# EasyEDA Pro project ProPrj_nfc keychain with screen_.epro

# Schematic Schematic1
Board Name: Board1; Create Date: 2026-09-26; Page Name: P1; Project Name: nfc keychain with screen; Schematic Name: Schematic1; Update Date: 2026-09-26; Company: EasyEDA.com; Page Size: A4; Version: V1.0
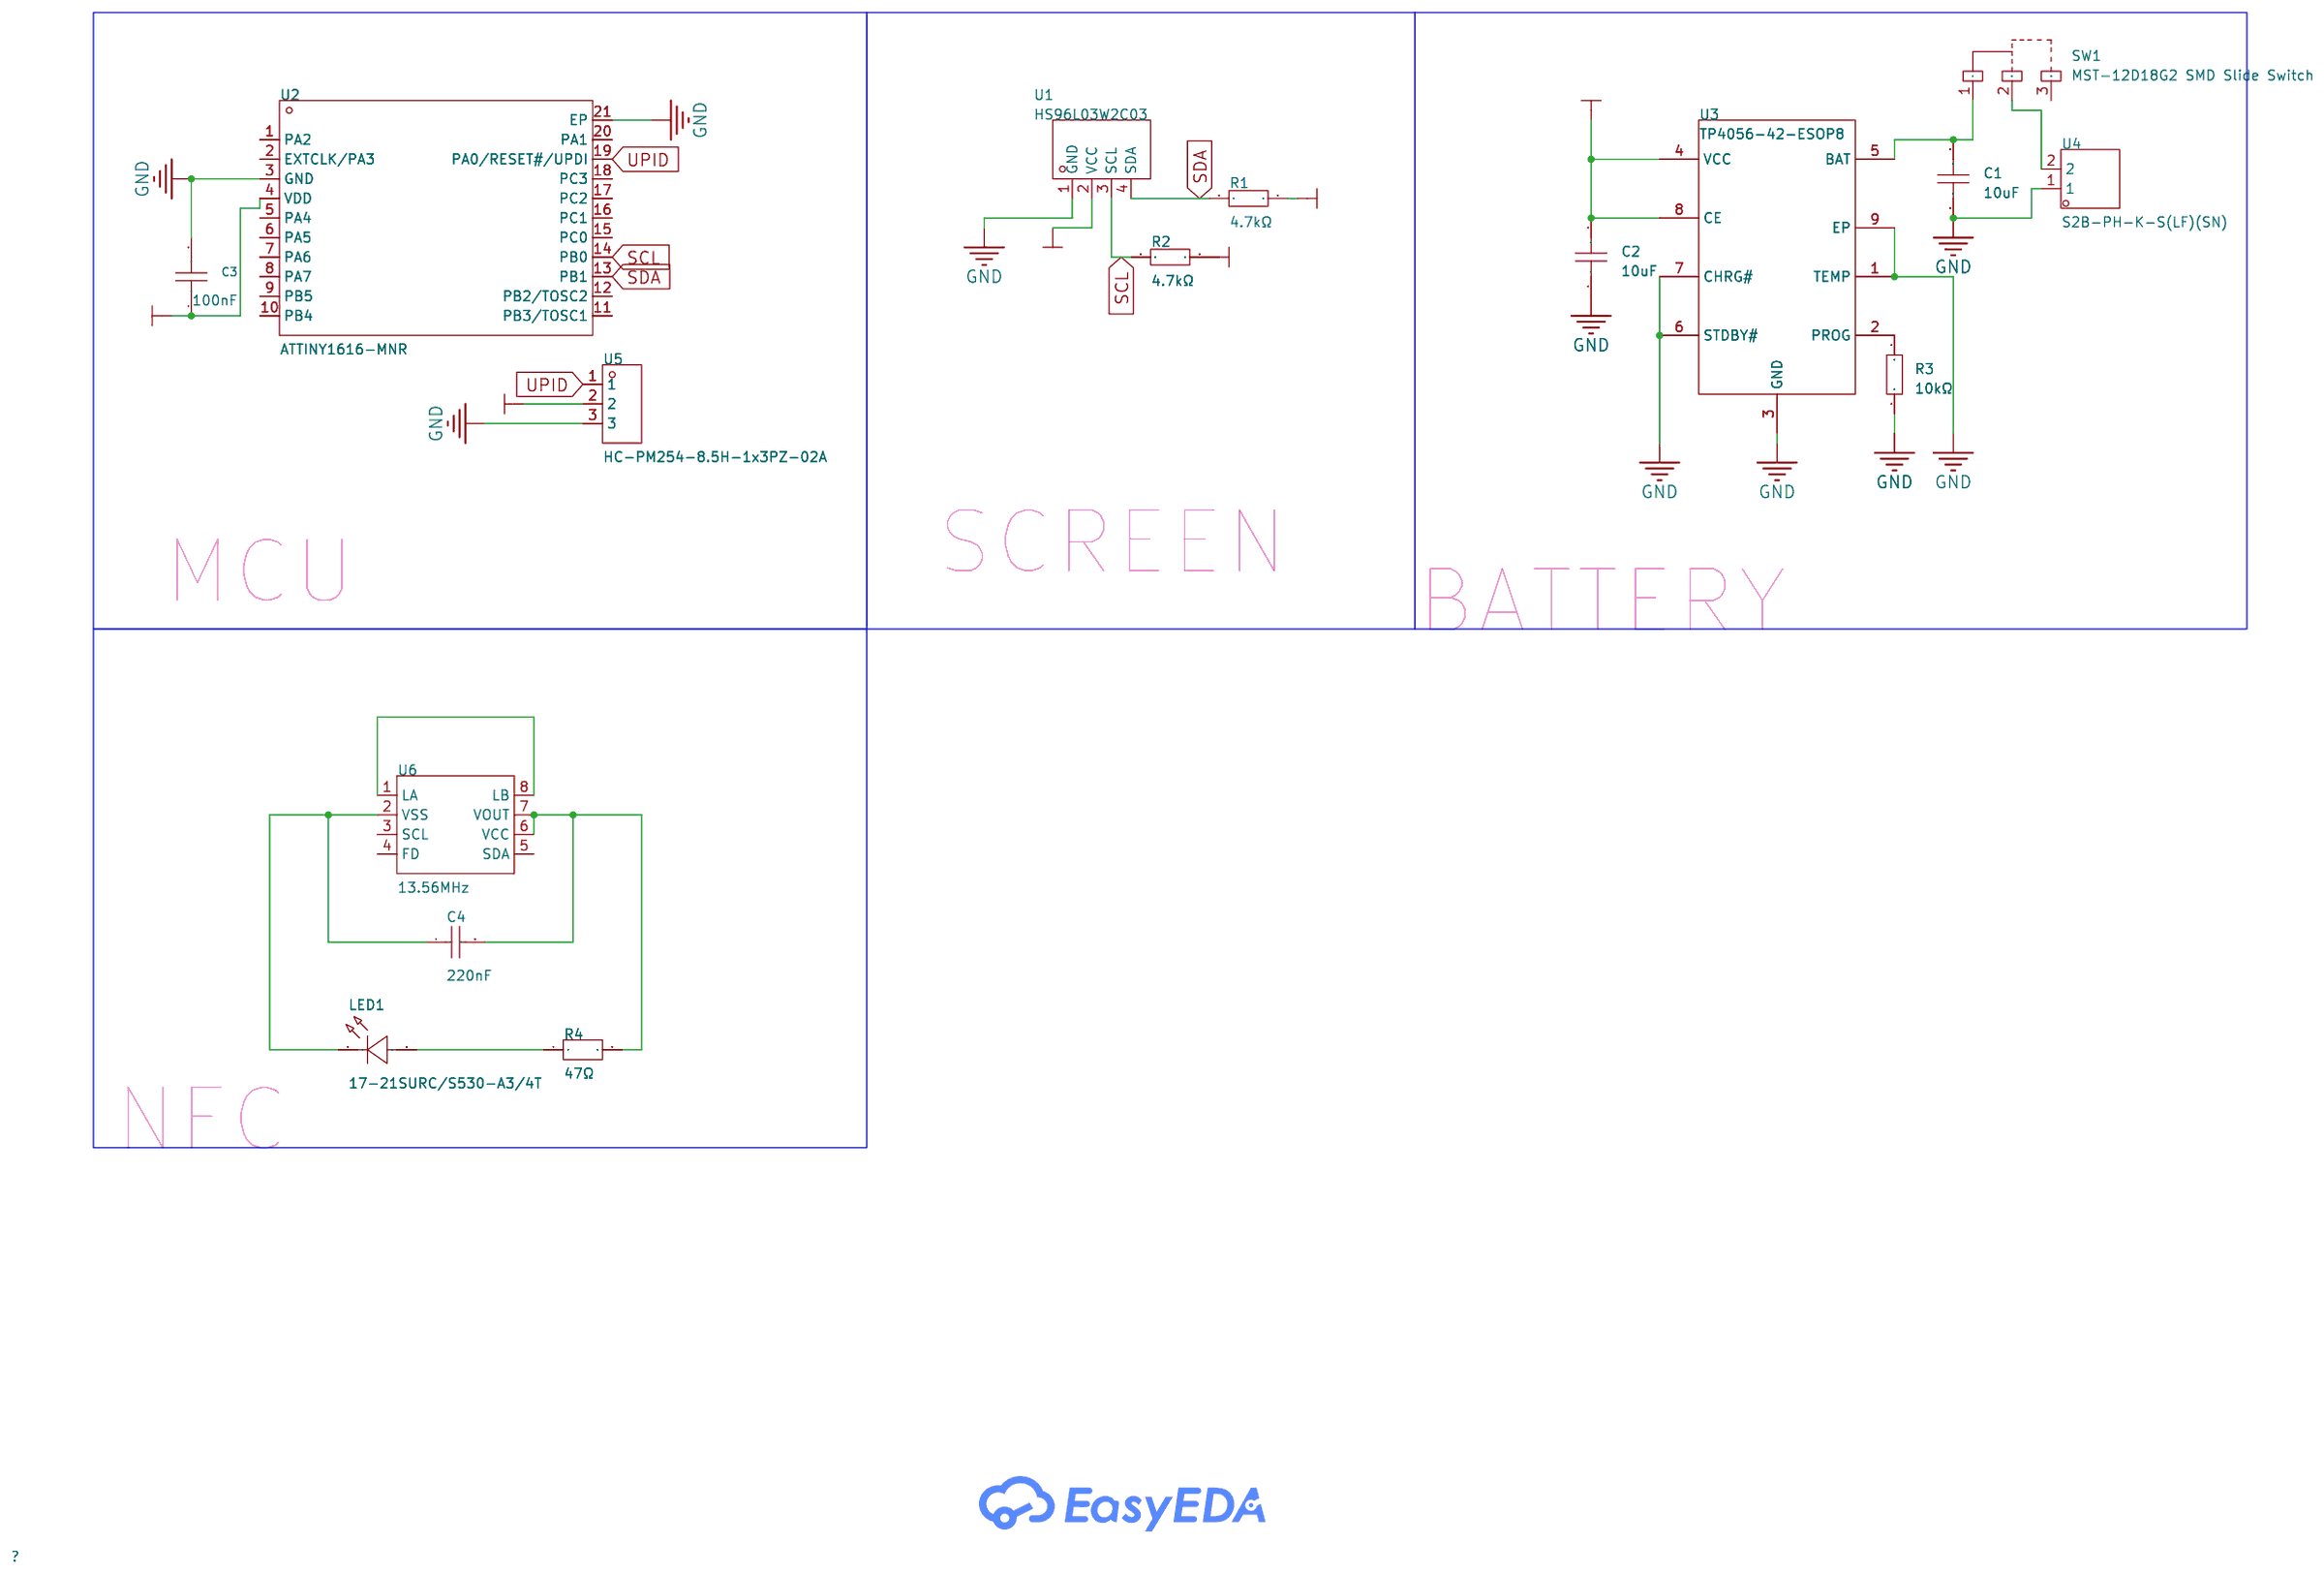
[diagram p0: schematic sheet]

## Parts
C1  10uF  [C0603]
C2  10uF  [C0603]
C3  100nF  [C0603]
C4  220nF  [C0402]
LED1  17-21SURC/S530-A3/4T  [LED0805-RD_ORANGE]
R1  4.7kΩ  [R0603]
R2  4.7kΩ  [R0603]
R3  10kΩ  [R0603]
R4  47Ω  [R0603]
SW1  MST-12D18G2 SMD Slide Switch  [SW-SMD_3P-L9.1-W3.5-P2.50_MST-12D18G2]
U1  HS96L03W2C03  [OLED-TH_L27.8-W27.2-P2.54_C9900033791]
U2  ATTINY1616-MNR  [QFN-20_L3.0-W3.0-P0.40-BL-EP1.7]
U3  TP4056-42-ESOP8  [ESOP-8_L4.9-W3.9-P1.27-LS6.0-BL-EP]
U4  S2B-PH-K-S(LF)(SN)  [CONN-TH_S2B-PH-K-S-LF-SN]
U5  HC-PM254-8.5H-1x3PZ-02A  [HDR-TH_3P-P2.54-V-F]
U6  13.56MHz  [XQFN-8_L1.6-W1.6-P0.50-BL_NT3H2111W0FHKH]

## Library data of the parts
C1 C2 = CL10A106KP8NNNC: Capacitance:10uF Tolerance:±10% Tolerance:±10% Voltage Rating:10V Temperature Coefficient:X5R; LCSC Part Name: 10uF ±10% 10V; Supplier Part: C19702; Manufacturer: SAMSUNG(三星); Supplier Footprint: 0603; JLCPCB Part Class: Basic Part; Datasheet: https://item.szlcsc.com/datasheet/CL10A106KP8NNNC/20411.html; Supplier: LCSC; Tolerance: ±10%; Voltage Rating: 10V; Temperature Coefficient: X5R
C3 = CL10B104KB8NNNC: Capacitance:100nF Tolerance:±10% Tolerance:±10% Voltage Rating:50V Temperature Coefficient:X7R; LCSC Part Name: 100nF ±10% 50V; Supplier Part: C1591; Manufacturer: SAMSUNG(三星); Supplier Footprint: 0603; JLCPCB Part Class: Extended Part; Datasheet: https://item.szlcsc.com/datasheet/CL10B104KB8NNNC/1943.html; Supplier: LCSC; Tolerance: ±10%; Voltage Rating: 50V; Temperature Coefficient: X7R
C4 = CL05B224KO5NNNC: Capacitance:220nF Tolerance:±10% Tolerance:±10% Voltage Rating:16V Temperature Coefficient:X7R; LCSC Part Name: 220nF ±10% 16V; Supplier Part: C16772; Manufacturer: SAMSUNG(三星); Supplier Footprint: 0402; JLCPCB Part Class: Basic Part; Datasheet: https://item.szlcsc.com/datasheet/CL05B224KO5NNNC/17456.html; Supplier: LCSC; Tolerance: ±10%; Voltage Rating: 16V; Temperature Coefficient: X7R
LED1 = 17-21SURC/S530-A3/4T: Lamp Holder Type:- Illumination Color:Orange Red Voltage - Forward(Vf):2V~2.4V Voltage - Forward(Vf):2V~2.4V Power(Watts):60mW Test Current:20mA Wavelength - Dominant:624nm Wavelength - Dominant:624nm Peak Wavelength:632nm Peak Wavelength:632nm Diode Conf; LCSC Part Name: 橙红 正贴; Supplier Part: C2943978; Manufacturer: EVERLIGHT(亿光); Supplier Footprint: 0805; JLCPCB Part Class: Extended Part; Datasheet: https://www.everlighteurope.com/custom/files/datasheets/DSE-0025713.pdf; Supplier: LCSC; Illumination Color: Orange Red; Voltage - Forward(Vf): 2V~2.4V; Power(Watts): 60mW; Test Current: 20mA; Wavelength - Dominant: 624nm; Peak Wavelength: 632nm; Diode Configuration: Discrete Diode; Lens Color: Water Clear; Luminous Intensity: 60mcd; Viewing Angle: 140°; Mounting Style: Top-mount; Operating Temperature: -40℃~+85℃
R1 R2 = RC0603FR-074K7L: Type:Thick Film Resistor Resistance:4.7kΩ Tolerance:±1% Tolerance:±1% Power(Watts):100mW Voltage-Supply(Max):75V Temperature Coefficient:±100ppm/℃ Temperature Coefficient:±100ppm/℃ Operating Temperature:-55℃~+155℃ Operating Temperature:-55℃~+155℃; LCSC Part Name: 厚膜电阻 4.7kΩ ±1% 100mW; Supplier Part: C99782; Manufacturer: YAGEO(国巨); Supplier Footprint: 0603; JLCPCB Part Class: Extended Part; Datasheet: https://item.szlcsc.com/datasheet/RC0603FR-074K7L/100996.html; Supplier: LCSC; Type: Thick Film Resistor; Tolerance: ±1%; Power(Watts): 100mW; Voltage-Supply(Max): 75V; Temperature Coefficient: ±100ppm/℃; Operating Temperature: -55℃~+155℃
R3 = RC0603FR-0710KL: Type:Thick Film Resistor Resistance:10kΩ Tolerance:±1% Tolerance:±1% Power(Watts):100mW Voltage-Supply(Max):75V Temperature Coefficient:±100ppm/℃ Temperature Coefficient:±100ppm/℃ Operating Temperature:-55℃~+155℃ Operating Temperature:-55℃~+155℃; LCSC Part Name: 厚膜电阻 10kΩ ±1% 100mW; Supplier Part: C98220; Manufacturer: YAGEO(国巨); Supplier Footprint: 0603; JLCPCB Part Class: Extended Part; Datasheet: https://item.szlcsc.com/datasheet/RC0603FR-0710KL/99429.html; Supplier: LCSC; Type: Thick Film Resistor; Tolerance: ±1%; Power(Watts): 100mW; Voltage-Supply(Max): 75V; Temperature Coefficient: ±100ppm/℃; Operating Temperature: -55℃~+155℃
R4 = FRC0603F47R0TS: Type:Thick Film Resistor Resistance:47Ω Tolerance:±1% Tolerance:±1% Power(Watts):100mW Voltage-Supply(Max):75V Temperature Coefficient:±100ppm/℃ Temperature Coefficient:±100ppm/℃ Operating Temperature:-55℃~+155℃ Operating Temperature:-55℃~+155℃; LCSC Part Name: 47Ω ±1% 100mW 厚膜电阻; Supplier Part: C2907043; Manufacturer: FOJAN(富捷); Supplier Footprint: 0603; JLCPCB Part Class: Extended Part; Datasheet: https://item.szlcsc.com/datasheet/FRC0603F47R0TS/3180556.html; Supplier: LCSC; Type: Thick Film Resistor; Tolerance: ±1%; Power(Watts): 100mW; Voltage-Supply(Max): 75V; Temperature Coefficient: ±100ppm/℃; Operating Temperature: -55℃~+155℃
SW1 = MST-12D18G2 SMD Slide Switch: Circuit:SPDT Actuator Style:Rectangular Columnar Termination Style:SMD(SMT) Tab Length:9.1mm Width:3.5mm Switch Height:5.5mm Mounting Type:Surface Mount, Right Angle Actuator Color:Black Current Rating:100mA Voltage Rating:12V Life:10,000 Cycles Operating; LCSC Part Name: MST-12D18G2卧式带柱编带; Supplier Part: C49023765; Manufacturer: SHOU HAN(首韩); Supplier Footprint: SMD; JLCPCB Part Class: Extended Part; Datasheet: https://item.szlcsc.com/datasheet/MST-12D18G2%2520SMD%2520Slide%2520Switch/51384140.html; Supplier: LCSC; Circuit: SPDT; Actuator Style: Rectangular Columnar; Termination Style: SMD(SMT) Tab; Length: 9.1mm; Width: 3.5mm; Switch Height: 5.5mm; Mounting Type: Surface Mount, Right Angle; Actuator Color: Black; Current Rating: 100mA; Voltage Rating: 12V; Life: 10,000 Cycles; Operating Temperature: -25℃~+70℃
U1 = HS96L03W2C03: Controller Type:SSD1315 chip Interface:I2C Size:0.96 Dot Pixels:128x64 Operating Temperature:-40℃~+70℃ Operating Temperature:-40℃~+70℃ Type of Drive:Passive (PMOLED) Display Range:21.744x10.864mm Display Color:White Luminance:180cd/m2 Function:- Quiescent; LCSC Part Name: 0.96寸OLED显示屏窄白光IIC; Supplier Part: C5248080; Manufacturer: HS(汉昇); JLCPCB Part Class: Extended Part; Datasheet: https://item.szlcsc.com/datasheet/HS96L03W2C03/5960631.html; Supplier: LCSC; Controller Type: SSD1315 chip; Interface: I2C; Size: 0.96; Dot Pixels: 128x64; Operating Temperature: -40℃~+70℃; Type of Drive: Passive (PMOLED); Display Range: 21.744x10.864mm; Display Color: White; Luminance: 180cd/m2
U2 = ATTINY1616-MNR: CPU Core:AVR CPU Maximum Speed:20MHz Core Size:8 Bit Program Storage Size:16KB Program Memory Type:FLASH RAM Size:2KB EEPROM:256Byte Number of I/O:18 ADC (Bit):10bit DAC (Bit):8bit Oscillator Type:Built-in Voltage - Supply:1.8V~5.5V Voltage - Supply:1.8V~; LCSC Part Name: tinyAVR 1系列处理器; Supplier Part: C507118; Manufacturer: MICROCHIP(美国微芯); Supplier Footprint: QFN-20-EP(3x3); JLCPCB Part Class: Extended Part; Datasheet: https://item.szlcsc.com/datasheet/ATTINY1616-MNR/520766.html; Supplier: LCSC; CPU Core: AVR; CPU Maximum Speed: 20MHz; Core Size: 8 Bit; Program Storage Size: 16KB; Program Memory Type: FLASH; RAM Size: 2KB; EEPROM: 256Byte; Number of I/O: 18; ADC (Bit): 10bit; DAC (Bit): 8bit; Oscillator Type: Built-in; Voltage - Supply: 1.8V~5.5V; Operating Temperature: -40℃~+105℃; Features: Window watchdog (WWDG)；Undervoltage detection (BOR/LVD/LVR/LVI)；Power-on reset (POR)；Built-in general-purpose timer；Hardware CRC；Touch function
U3 = TP4056-42-ESOP8: The Chip Type:Charging IC Voltage - Supply:4V~8V Voltage - Supply:4V~8V Charge Current - Max:1A Charging Saturation Voltage:4.2V End-Off Voltage:- Type of Battery:Lithium Battery Number of Cells:1 Number of Cells:1 Operating Temperature:-40℃~+85℃ Operatin; LCSC Part Name: 1A线性锂离子电池充电器; Supplier Part: C16581; Manufacturer: TOPPOWER(南京拓微); Supplier Footprint: ESOP-8; JLCPCB Part Class: Extended Part; Datasheet: https://item.szlcsc.com/datasheet/TP4056-42-ESOP8/17264.html; Supplier: LCSC; The Chip Type: Charging IC; Voltage - Supply: 4V~8V; Charge Current - Max: 1A; Charging Saturation Voltage: 4.2V; Type of Battery: Lithium Battery; Number of Cells: 1; Operating Temperature: -40℃~+85℃; Battery Temperature Detection: Support; Supply Current (Iq): 2uA; Features: Constant voltage charging；Constant current charging；Automatic recharge；Charge termination；Soft-start；Programmable charging current；Under-voltage lockout；Trickle charging
U4 = S2B-PH-K-S(LF)(SN): Pins Structure:1x2P Pitch:2mm Mounting Type:Right Angle Reference Series:PH Number of Pins:2P Number of Rows:1 Number of PINs Per Row:2 Row Spacing:- Current Rating:2A Contact Material:Brass Contact Plating:Tin Operating Temperature:-25℃~+85℃ Operating Te; LCSC Part Name: 1x2P 间距:2mm 弯插 系列:PH; Supplier Part: C173752; Manufacturer: JST; Supplier Footprint: 弯插,P=2mm; JLCPCB Part Class: Extended Part; Datasheet: https://item.szlcsc.com/datasheet/S2B-PH-K-S(LF)(SN)/185142.html; Supplier: LCSC; Pins Structure: 1x2P; Pitch: 2mm; Mounting Type: Right Angle; Reference Series: PH; Number of Pins: 2P; Number of Rows: 1; Number of PINs Per Row: 2; Current Rating: 2A; Contact Material: Brass; Contact Plating: Tin; Operating Temperature: -25℃~+85℃; Voltage Rating: 100V; Plastic Material: PA66; Flame Retardant Rating: UL94V-0; Supplementary Features: K Pin; Color: White; Z-Height of the Board: 4.8mm; X-Length of Bottom Edge on Board (Spacing Line): 5.9mm; Y-Width of Bottom Edge on Board: 7.6mm
U5 = HC-PM254-8.5H-1x3PZ-02A: Holes Structure:1x3P Pitch:2.54mm Row Spacing:- Circular Hole / Square Hole:Square Hole Mounting Type:Through Hole Number of Rows:1 Number of Positions:3P Current Rating:3A Voltage Rating (Max):- Holes Direction:Top Insulation Height:8.5mm Contact Materia; LCSC Part Name: 间距2.54mm 1x3Pin 直插 PC3.0 H8.5; Supplier Part: C22373889; Manufacturer: HC(虹成电子); Supplier Footprint: 插件,P=2.54mm; JLCPCB Part Class: Extended Part; Datasheet: https://item.szlcsc.com/datasheet/HC-PM254-8.5H-1x3PZ-02A/23870225.html; Supplier: LCSC; Holes Structure: 1x3P; Pitch: 2.54mm; Circular Hole / Square Hole: Square Hole; Mounting Type: Through Hole; Number of Rows: 1; Number of Positions: 3P; Current Rating: 3A; Holes Direction: Top; Insulation Height: 8.5mm; Contact Material: Brass; Contact Plating: Gold; Operating Temperature: -40℃~+105℃; PIN Length: 3mm
U6 = NT3H2111W0FHKH: agreement:ISO 14443A,NFC Interface:I2C transmission rate:106Kbit/s Frequency:13.56MHz Frequency:13.56MHz Voltage - Supply:3.3V Voltage - Supply:3.3V Features:Energy harvesting；Built-in non-volatile memory；Data verification; LCSC Part Name: NFC Forum T2T 带 I²C 接口、密码保护和能量收集; Supplier Part: C710403; Manufacturer: NXP(恩智浦); Supplier Footprint: XQFN-8(1.6x1.6); JLCPCB Part Class: Extended Part; Datasheet: https://www.nxp.com/docs/en/data-sheet/NT3H2111_2211.pdf; Supplier: LCSC; agreement: ISO 14443A,NFC; Interface: I2C; transmission rate: 106Kbit/s; Voltage - Supply: 3.3V; Features: Energy harvesting；Built-in non-volatile memory；Data verification

## Nets
GND: C1.1 C2.1 C3.2 R3.1 U1.1(GND) U2.3(GND) U2.21(EP) U3.1(TEMP) U3.3(GND) U3.6(STDBY#) U3.7(CHRG#) U3.9(EP) U4.1 U5.3
VIN: C2.2 C3.1 R1.1 R2.1 U1.2(VCC) U2.4(VDD) U3.4(VCC) U3.8(CE) U5.2
SCL: R2.2 U1.3(SCL) U2.14(PB0)
SDA: R1.2 U1.4(SDA) U2.13(PB1)
UPID: U2.19(PA0/RESET#/UPDI) U5.1
$1N875: R3.2 U3.2(PROG)
$1N2217: C1.2 SW1.1 U3.5(BAT)
$1N2220: SW1.2 U4.2
$1N2934: C4.2 R4.2 U6.6(VCC) U6.7(VOUT)
$1N2950: C4.1 LED1.1(K) U6.2(VSS)
$1N2971: LED1.2(A) R4.1
$1N3162: U6.1(LA) U6.8(LB)

Not connected (* = marked no-connect by the designer): SW1 3; U2 1(PA2) 2(EXTCLK/PA3) 5(PA4) 6(PA5) 7(PA6) 8(PA7) 9(PB5) 10(PB4) 11(PB3/TOSC1) 12(PB2/TOSC2) 15(PC0) 16(PC1) 17(PC2) 18(PC3) 20(PA1); U6 3(SCL) 4(FD) 5(SDA)

## Notes on the sheet
- SCREEN
- MCU
- BATTERY
- NFC

# Board PCB1
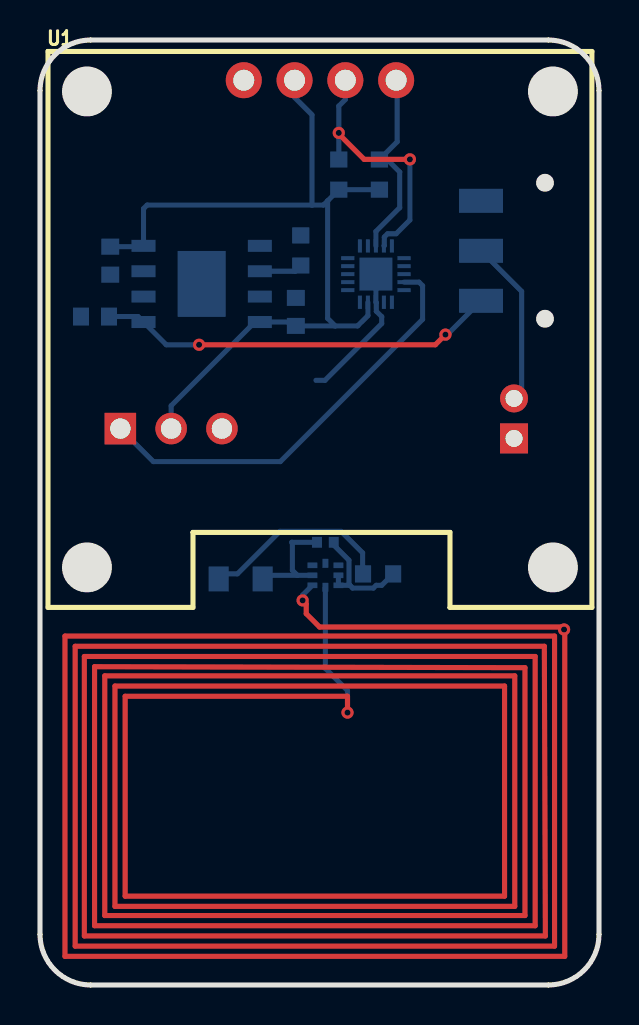
[diagram p1: board, top side]
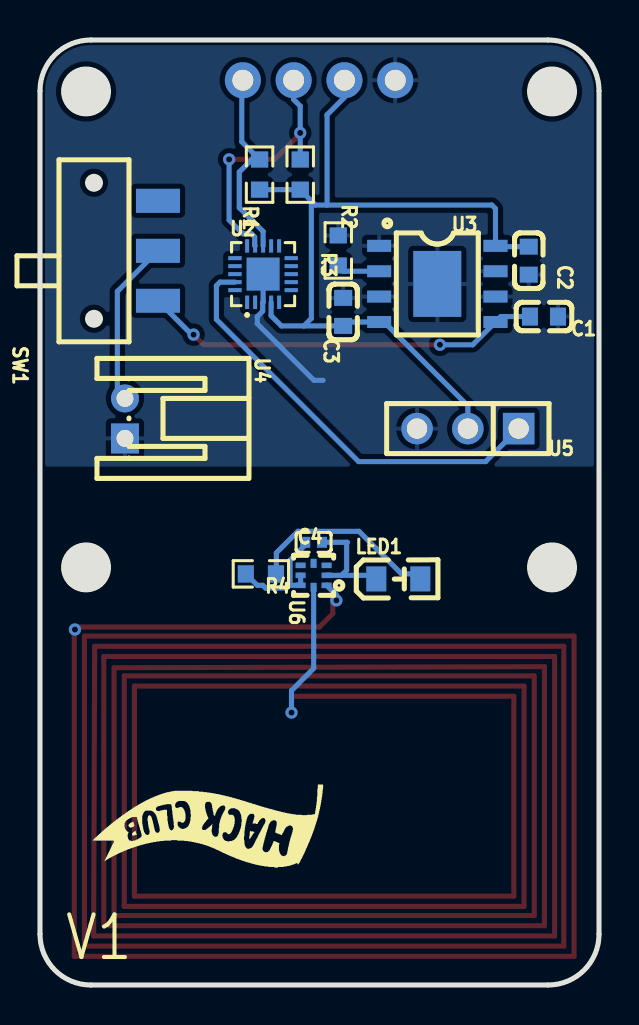
[diagram p2: board, bottom side, seen from below]

Outline 27.95 x 47.25 mm; copper layers: Top Layer, Bottom Layer. Coordinates in mm from the lower left corner of the outline.
Outline path: 0,44.71 0,2.54 arc(0.74,0.74) 2.54,0 25.41,0 arc(27.21,0.74) 27.95,2.54 27.95,44.71 arc(27.21,46.51) 25.41,47.25 2.54,47.25 arc(0.74,46.51) 0,44.71
Stack: Top Layer 0.035mm / Dielectric1 1.51mm FR4 er 4.5 / Bottom Layer 0.035mm

## Design rules (mm)
template: JLCPCB Capability(Two Layers Board)
spacing copperThickness1oz (default): track to track 0.102, other pairs 0.152 to 0.3
spacing copperThickness2oz: track to track 0.203, other pairs 0.152 to 0.3
track width copperThickness1oz (default): min 0.127, default 0.254, max 2.54
track width copperThickness2oz: min 0.203, default 0.254, max 2.54
differential pair differentialPair (default): width min 0.127, default 0.254, max 2.54; gap min 0.152, default 0.152
via viaSize (default): diameter min 0.5, default 0.61, max 10; hole min 0.3, default 0.305, max 6.3

## Placement (name value [footprint] x y rotation side)
C1  10uF  [C0603]  2.75 33.43 0 bottom
C2  10uF  [C0603]  3.51 36.22 90 bottom
C3  100nF  [C0603]  12.79 33.66 90 bottom
C4  220nF  [C0402]  14.27 22.14 0 bottom
LED1  17-21SURC/S530-A3/4T  [LED0805-RD_ORANGE]  10.03 20.3 180 bottom
R1  4.7kΩ  [R0603]  16.97 40.52 90 bottom
R2  4.7kΩ  [R0603]  14.94 40.52 90 bottom
R3  10kΩ  [R0603]  13.04 36.73 270 bottom
R4  47Ω  [R0603]  16.91 20.56 0 bottom
SW1  MST-12D18G2 SMD Slide Switch  [SW-SMD_3P-L9.1-W3.5-P2.50_MST-12D18G2]  22.05 36.71 90 bottom
U1  HS96L03W2C03  [OLED-TH_L27.8-W27.2-P2.54_C9900033791]  14 45.24 0 top
U2  ATTINY1616-MNR  [QFN-20_L3.0-W3.0-P0.40-BL-EP1.7]  16.8 35.55 180 bottom
U3  TP4056-42-ESOP8  [ESOP-8_L4.9-W3.9-P1.27-LS6.0-BL-EP]  8.08 35.06 270 bottom
U4  S2B-PH-K-S(LF)(SN)  [CONN-TH_S2B-PH-K-S-LF-SN]  23.7 28.33 270 bottom
U5  HC-PM254-8.5H-1x3PZ-02A  [HDR-TH_3P-P2.54-V-F]  6.56 27.82 0 bottom
U6  13.56MHz  [XQFN-8_L1.6-W1.6-P0.50-BL_NT3H2111W0FHKH]  14.27 20.49 90 bottom

## Footprints (pads in the part's own frame, mm; a bottom-side part is the same pattern mirrored in y, then rotated)
C0402
  rect 0.5x0.54 smd: 1(-0.42,0) 2(0.42,0)
C0603
  rect 0.8x0.9 smd: 1(-0.7,0) 2(0.7,0)
CONN-TH_S2B-PH-K-S-LF-SN
  rect 1.5x1.4 hole 0.85: 1(1,0)
  round 1.4 hole 0.85: 2(-1,0)
ESOP-8_L4.9-W3.9-P1.27-LS6.0-BL-EP
  rect 0.6x1.2 smd: 1(-1.905,-2.909) 2(-0.635,-2.909) 3(0.635,-2.909) 4(1.905,-2.909) 5(1.905,2.909) 6(0.635,2.909) 7(-0.635,2.909) 8(-1.905,2.909)
  rect 3.3x2.4 smd: 9(0,0)
HDR-TH_3P-P2.54-V-F
  rect 1.575x1.575 hole 1.02: 1(-2.54,0)
  round 1.575 hole 1.02: 2(0,0) 3(2.54,0)
LED0805-RD_ORANGE
  rect 1x1.25 smd: 1(-1.1,0) 2(1.1,0)
OLED-TH_L27.8-W27.2-P2.54_C9900033791
  round 1.8 hole 1.05: 1(-3.81,0) 2(-1.27,0) 3(1.27,0) 4(3.81,0)
QFN-20_L3.0-W3.0-P0.40-BL-EP1.7
  rect 0.2x0.665 smd: 1(-0.8,-1.407) 2(-0.4,-1.407) 3(0,-1.407) 4(0.4,-1.407) 5(0.8,-1.407) 11(0.8,1.407) 12(0.4,1.407) 13(0,1.407) 14(-0.4,1.407) 15(-0.8,1.407)
  rect 0.665x0.2 smd: 6(1.407,-0.8) 7(1.407,-0.4) 8(1.407,0) 9(1.407,0.4) 10(1.407,0.8) 16(-1.407,0.8) 17(-1.407,0.4) 18(-1.407,0) 19(-1.407,-0.4) 20(-1.407,-0.8)
  rect 1.65x1.65 smd: 21(0,0)
R0603
  rect 0.806x0.864 smd: 1(-0.753,0) 2(0.753,0)
SW-SMD_3P-L9.1-W3.5-P2.50_MST-12D18G2
  rect 1.2x2.2 smd: 1(-2.5,0) 2(0,0) 3(2.5,0)
XQFN-8_L1.6-W1.6-P0.50-BL_NT3H2111W0FHKH
  rect 0.28x0.5 smd: 1(-0.5,-0.65) 2(0,-0.65) 3(0.5,-0.65) 5(0.5,0.65) 6(0,0.65) 7(-0.5,0.65)
  rect 0.45x0.3 smd: 4(0.6,0) 8(-0.6,0)

## Nets
As in the schematic.

Pads without a net: SW1 3; U2 1 2 5 6 7 8 9 10 11 12 15 16 17 18 20; U6 3 4 5

## Via types
v1: diameter 0.61, hole 0.305, Top Layer to Bottom Layer, 7 vias

## Routing (per net, layer and track width the routed paths; a pad name or vN(x,y) marks a point on that pad's centre or on a via; arc(x,y) is an arc through that point)
GND: length 7.1
  Bottom Layer w0.254: 13.8,30.24 14.25,30.24 17.09,33.07 17.09,33.42 16.82,33.69 16.82,34.12 16.8,34.14 U2.21
VIN: length 42.4
  Bottom Layer w0.254: 14.76,32.96 15.88,32.96 16.4,33.47 16.4,34.14 ; 14.76,32.96 14.38,33.33 14.38,39.21 ; 14.76,32.96 C3.1 12.6,33.15 U3.4 10.74,33.15 6.56,28.97 U5.2 ; 13.6,39 13.6,43.52 12.73,44.39 12.73,45.24 ; 13.6,39 5.36,39 5.18,38.82 U3.8 5.14,36.92 C2.2 ; 13.6,39 14.17,39 14.38,39.21 ; R1.1 R2.1 14.38,39.21
SCL: length 13.3
  Top Layer w0.254: 14.94,42.56 16.21,41.29 v1(18.5,41.29)
  Bottom Layer w0.254: U1.3 15.27,44.28 14.94,43.95 v1(14.94,42.61) R2.2 ; v1(18.5,41.29) 18.5,38.25 17.81,37.57 17.38,37.57 17.22,37.4 17.22,36.97 U2.14
SDA: length 9.8
  Bottom Layer w0.254: U1.4 17.86,45.19 17.86,42.17 R1.2 17.36,41.28 17.99,40.65 17.99,38.87 16.8,37.68 U2.13
UPID: length 21.4
  Bottom Layer w0.254: U2.19 18.95,35.15 19.13,34.97 19.13,33.28 12.02,26.17 5.67,26.17 U5.1
$1N875: length 2.2
  Bottom Layer w0.254: U3.2 12.75,35.69 R3.2
$1N2217: length 20.1
  Top Layer w0.254: v1(7.96,32.01) 19.77,32.01 v1(20.27,32.52)
  Bottom Layer w0.254: v1(20.27,32.52) 20.36,32.52 SW1.1 ; v1(7.96,32.01) 6.31,32.01 U3.5 4.9,33.43 C1.2
$1N2220: length 8.4
  Bottom Layer w0.254: U4.2 24.08,29.71 24.08,34.68 SW1.2
$1N2934: length 6.1
  Bottom Layer w0.254: 15.5,19.99 U6.7 U6.6 ; 15.5,19.99 15.45,20.03 15.45,21.24 14.69,22 C4.2 ; 15.5,19.99 15.63,19.85 16.67,19.85 16.81,19.99 17.09,19.99 R4.2
$1N2950: length 5.6
  Bottom Layer w0.254: LED1.1 11.32,20.49 12.87,20.49 ; 12.87,20.49 12.62,20.74 12.62,22.11 12.59,22.14 C4.1 ; 12.87,20.49 U6.2
$1N2971: length 9.7
  Bottom Layer w0.254: R4.1 16.13,20.58 16.13,21.61 15.06,22.69 12,22.69 9.87,20.56 9.19,20.56 LED1.2
$1N3162: length 504.7
  Top Layer w0.254: v1(15.38,13.62) 15.38,14.44 4.26,14.44 4.26,4.44 23.23,4.44 23.23,14.95 3.75,14.95 3.75,3.93 23.74,3.93 23.74,15.46 3.24,15.46 3.24,3.47 24.25,3.47 24.25,15.87 2.73,15.92 2.73,2.96 24.76,2.96 24.76,16.43 2.22,16.43 2.22,2.45 25.27,2.45 25.22,16.94 1.76,16.94 1.76,1.94 25.73,1.94 25.73,17.45 1.25,17.45 1.25,1.43 26.24,1.43 26.24,17.74 v1(26.2,17.78) 26.08,17.9 13.98,17.9 13.31,18.57 13.31,19.05 v1(13.13,19.23)
  Bottom Layer w0.254: v1(15.38,13.62) 15.38,14.72 14.27,15.83 U6.8 ; v1(13.13,19.23) 13.13,19.5 U6.1

## Copper pours and planes (outline as drawn; the poured copper is in the pictures)
GND on Bottom Layer: -1.32,47.89 29.93,47.89 29.93,25.92 -1.32,25.92

## Text on the board
Bottom Silkscreen Layer: V1
